# Altium schematic sheet Power.SchDoc
size A4; SheetNumber: 2; SheetTotal: 3
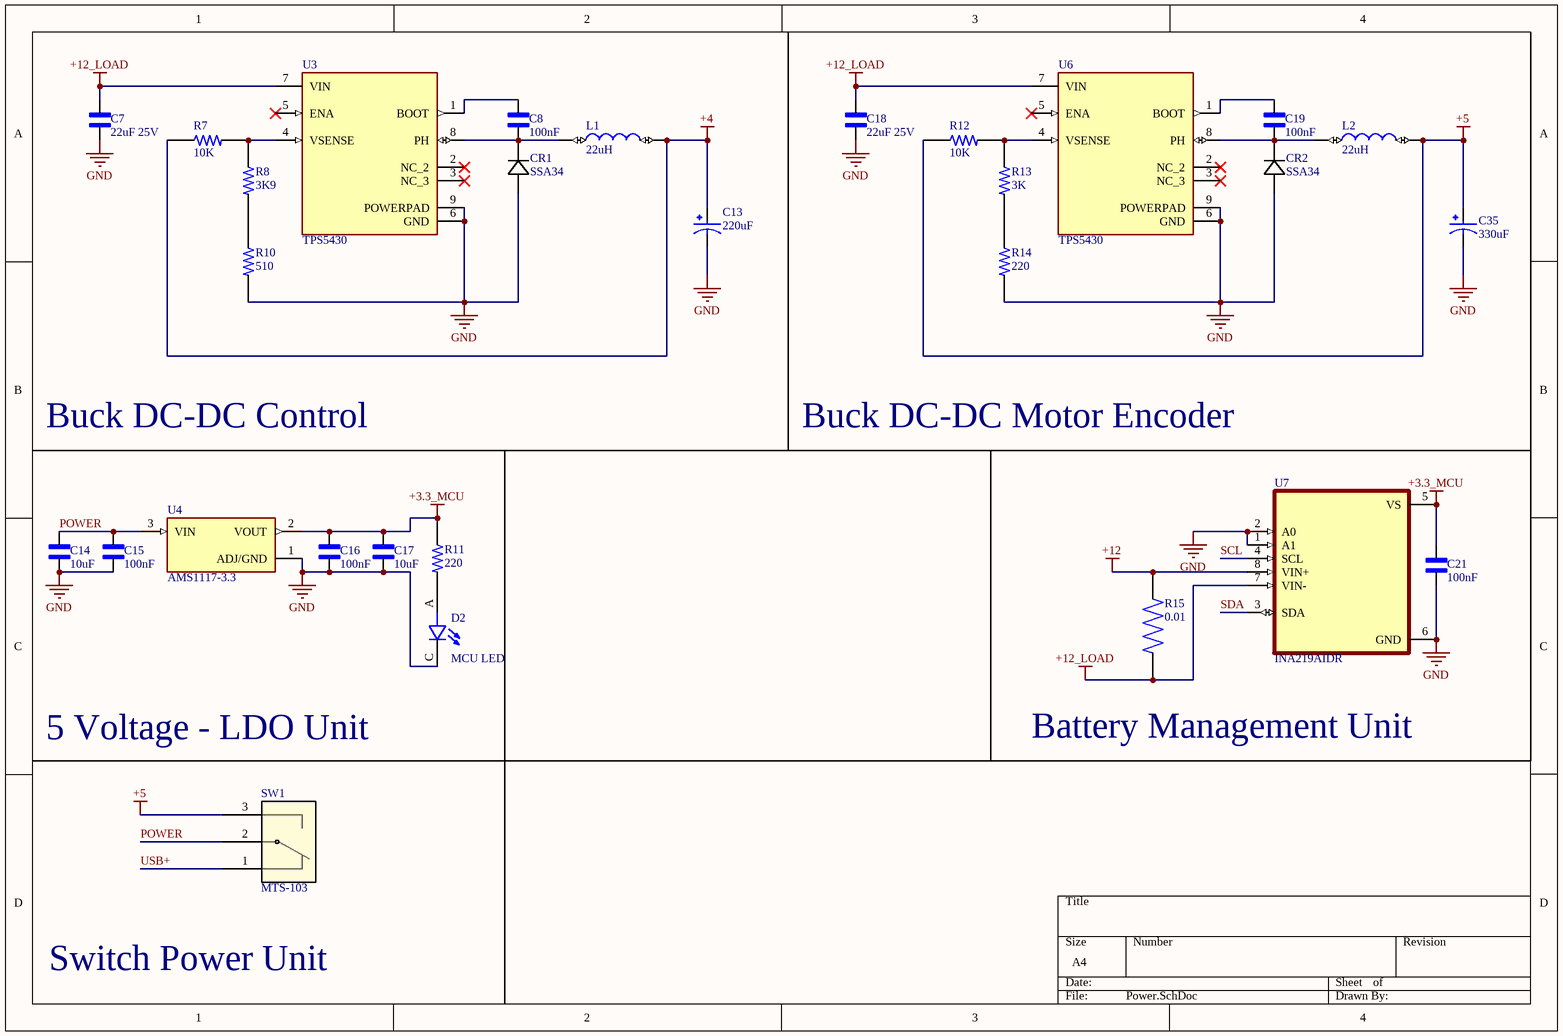
[diagram p0: Power.SchDoc]

## Parts
C7  22uF 25V  [CAPC3216X229N]
C8  100nF  [CAPC1608X90N]
C13  220uF  [CAPPM6032X280N]
C14  10uF  [CAPC3216X110N]
C15  100nF  [CAPC1608X90N]
C16  100nF  [CAPC1608X90N]
C17  10uF  [CAPC3216X110N]
C18  22uF 25V  [CAPC3216X229N]
C19  100nF  [CAPC1608X90N]
C21  100nF  [CAPC1608X90N]
C35  330uF  [CAP_EEEFP1V101AP]
CR1  SSA34  [CR_A34-E35AT_VIS]
CR2  SSA34  [CR_A34-E35AT_VIS]
D2  MCU LED  [LEDSC125X200X90-2N]
L1  22uH  [INDPM120120X800N]
L2  22uH  [INDPM120120X800N]
R7  10K  [RESC1607X60N]
R8  3K9  [RESC1607X60N]
R10  510  [RESC1607X60N]
R11  220  [RESC1607X60N]
R12  10K  [RESC1607X60N]
R13  3K  [RESC1607X60N]
R14  220  [RESC1607X60N]
R15  0.01  [RESC6331X85N]
SW1  MTS-103  [MTS-103_JCV]
U3  TPS5430  [CONV_TPS5430DDAR]
U4  AMS1117-3.3  [SOT229P700X180-4N]
U6  TPS5430  [CONV_TPS5430DDAR]
U7  INA219AIDR  [SOIC127P599X175-8N]

## Nets
+3.3_MCU: C16.2 C17.1 C21.2 R11.1 U4.2(VOUT) U7.5(VS)
+4: C13.1 L1.2 R7.1
+5: C35.1 L2.2 R12.1 SW1.3
+12: R15.2 U7.8(VIN+)
+12_LOAD: C7.2 C18.2 R15.1 U3.7(VIN) U6.7(VIN) U7.7(VIN-)
GND: C7.1 C13.2 C14.2 C15.1 C16.1 C17.2 C18.1 C21.1 C35.2 CR1.2 CR2.2 D2.C R10.2 R14.2 U3.6(GND) U3.9(POWERPAD) U4.1(ADJ/GND) U6.6(GND) U6.9(POWERPAD) U7.1(A1) U7.2(A0) U7.6(GND)
POWER: C14.1 C15.2 SW1.2 U4.3(VIN)
SCL: U7.4(SCL)
SDA: U7.3(SDA)
USB+: SW1.1
NetC8_1: C8.1 CR1.1 L1.1 U3.8(PH)
NetC8_2: C8.2 U3.1(BOOT)
NetC19_1: C19.1 CR2.1 L2.1 U6.8(PH)
NetC19_2: C19.2 U6.1(BOOT)
NetD2_A: D2.A R11.2
NetR7_2: R7.2 R8.1 U3.4(VSENSE)
NetR8_2: R8.2 R10.1
NetR12_2: R12.2 R13.1 U6.4(VSENSE)
NetR13_2: R13.2 R14.1

Not connected (* = marked no-connect by the designer): U3 2(NC_2)* 3(NC_3)* 5(ENA)*; U6 2(NC_2)* 3(NC_3)* 5(ENA)*

## Notes on the sheet
- Buck DC-DC Control
- Buck DC-DC Motor Encoder
- 5 Voltage - LDO Unit
- Battery Management Unit
- Switch Power Unit

## Library data of the parts
C7 C18 = 12063D226KAT2A: MF: {'manufacturer': u'KYOCERA AVX'}; Package: None; Price: None; Value: *; MP: 12063D226KAT2A; Availability: Unavailable
C8 C15 C16 C19 C21 = GRM188R71H104KA93D: SMD Capacitor X7R(EIA) with Capacitance: 0.10uF Tol. 10%. Rated Voltage: 50Vdc; MF: Murata; SnapEDA_Link: https://www.snapeda.com/parts/GRM188R71H104KA93D/Murata/view-part/?ref=snap; Package: 1608 Murata; Value: *; MP: GRM188R71H104KA93D; Check_prices: https://www.snapeda.com/parts/GRM188R71H104KA93D/Murata/view-part/?ref=eda
C13 = T493C227K006CH6410: 220 ÂµF Molded Tantalum Capacitors 6.3 V 2312 (6032 Metric) 1.2Ohm @ 100kHz; MF: Kemet; SnapEDA_Link: https://www.snapeda.com/parts/T493C227K006CH6410/Kemet/view-part/?ref=snap; Package: SMD-2 Kemet; Value: *; MP: T493C227K006CH6410; Check_prices: https://www.snapeda.com/parts/T493C227K006CH6410/Kemet/view-part/?ref=eda
C14 C17 = T491A106K010AT7280: 10 ÂµF Molded Tantalum Capacitors 10 V 1206 (3216 Metric) 3.8Ohm; MF: KEMET; SnapEDA_Link: https://www.snapeda.com/parts/T491A106K010AT7280/KEMET/view-part/?ref=snap; Package: SMD-2 KEMET; Value: *; MP: T491A106K010AT7280; Check_prices: https://www.snapeda.com/parts/T491A106K010AT7280/KEMET/view-part/?ref=eda
C35 = EEEFP1V101AP: 100ÂµF 35V Aluminum Electrolytic Capacitors Radial, Can - SMD 80mOhm @ 100kHz 2000 Hrs @ 105Â°C; MF: Panasonic Electronic; MP: EEE-FP1V101AP; SnapEDA_Link: https://www.snapeda.com/parts/EEE-FP1V101AP/Panasonic/view-part/?ref=snap; Package: RADIAL-2 Panasonic; Value: *; Check_prices: https://www.snapeda.com/parts/EEE-FP1V101AP/Panasonic/view-part/?ref=eda
CR1 CR2 = SSA34-E35AT: 3A,40V,SMA SKY RECT; Manufacturer_Name: Vishay; Manufacturer_Part_Number: SSA34-E3/5AT; Copyright: Copyright (C) 2026 Ultra Librarian. All rights reserved.
D2 = 5990110007F: Red 633nm LED Indication - Discrete 2.1V 0805 (2012 Metric); MF: Dialight; MP: 599-0110-007F; Check_prices: https://www.snapeda.com/parts/599-0110-007F/Dialight/view-part/?ref=eda; Value: *; Purchase-URL: https://pricing.snapeda.com/search/part/599-0110-007F/?ref=eda; Price: None; SnapEDA_Link: https://www.snapeda.com/parts/599-0110-007F/Dialight/view-part/?ref=snap; Availability: In Stock; Package: 0805 Dialight
L1 L2 = CDRH127_LDNP-221MC: 220 ÂµH Shielded - Inductor 1.45 A 338mOhm Max Nonstandard; MF: Sumida America; MP: CDRH127/LDNP-221MC; SnapEDA_Link: https://www.snapeda.com/parts/CDRH127/LDNP-221MC/Sumida+America+Components+Inc./view-part/?ref=snap; Package: Nonstandard Sumida; Value: *; Check_prices: https://www.snapeda.com/parts/CDRH127/LDNP-221MC/Sumida+America+Components+Inc./view-part/?ref=eda
R7 R8 R10-R14 = RC0603FR-071K2L: 1.2 kOhms Â±1% 0.1W, 1/10W Chip Resistor 0603 (1608 Metric) Moisture Resistant Thick Film; MF: Yageo; SnapEDA_Link: https://www.snapeda.com/parts/RC0603FR-071K2L/Yageo/view-part/?ref=snap; Package: SMD-2 Yageo; Value: *; MP: RC0603FR-071K2L; Check_prices: https://www.snapeda.com/parts/RC0603FR-071K2L/Yageo/view-part/?ref=eda
R15 = CSNL2512FT1L00: 1 mOhms Â±1% 2W Chip Resistor 2512 (6432 Metric) Current Sense, Moisture Resistant Metal Element; MF: Stackpole Electronics Inc; SnapEDA_Link: https://www.snapeda.com/parts/CSNL2512FT1L00/Stackpole+Electronics/view-part/?ref=snap; Package: 6331 Stackpole; Value: *; MP: CSNL2512FT1L00; Check_prices: https://www.snapeda.com/parts/CSNL2512FT1L00/Stackpole+Electronics/view-part/?ref=eda
SW1 = MTS-103: Description; Manufacturer_Name: Jameco Valuepro; Type: Toggle Switches; Copyright: Copyright (C) 2026 Ultra Librarian. All rights reserved.; Manufacturer_Part_Number: MTS-103; RefDes: RefDes
U3 U6 = TPS5430DDAR: 5.5V to 36V Input, 3A, 500kHz Step-Down Converter; MF: Texas Instruments; Package: HSOIC-8 Texas Instruments; Check_prices: https://www.snapeda.com/parts/TPS5430DDAR/Texas+Instruments/view-part/?ref=eda; Value: *; Purchase-URL: https://pricing.snapeda.com/search/part/TPS5430DDAR/?ref=eda; Availability: In Stock; SnapEDA_Link: https://www.snapeda.com/parts/TPS5430DDAR/Texas+Instruments/view-part/?ref=snap; MP: TPS5430DDAR; Price: None
U4 = AMS1117-3.3: Linear Voltage Regulator IC Positive Fixed 1 Output 1A SOT-223-3L; MF: UMW; SnapEDA_Link: https://www.snapeda.com/parts/AMS1117-3.3/UMW/view-part/?ref=snap; Package: SOT-223-3L UMW; Value: *; MP: AMS1117-3.3; Check_prices: https://www.snapeda.com/parts/AMS1117-3.3/UMW/view-part/?ref=eda
U7 = INA219AIDR: 26-V 12-bit I2C output digital power monitor; MF: Texas Instruments; SnapEDA_Link: https://www.snapeda.com/parts/INA219AIDR/Texas+Instruments/view-part/?ref=snap; Package: SOIC-8 Texas Instruments; Value: *; MP: INA219AIDR; Check_prices: https://www.snapeda.com/parts/INA219AIDR/Texas+Instruments/view-part/?ref=eda